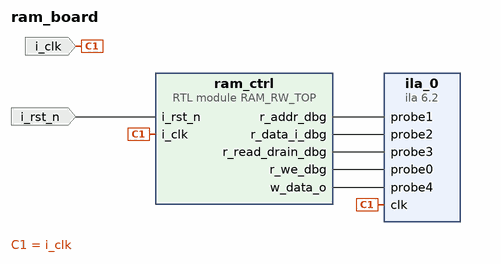
[diagram p0: block diagram of the top level]
# Vivado block design ram_board, xc7z020clg484-2, Vivado 2023.1
create_bd_design ram_board

create_bd_port -dir I -type clk i_clk
set_property -dict {CONFIG.FREQ_HZ 50000000} [get_bd_ports i_clk]
create_bd_port -dir I -type rst i_rst_n
set_property -dict {CONFIG.POLARITY ACTIVE_LOW} [get_bd_ports i_rst_n]

create_bd_cell -type module -reference RAM_RW_TOP ram_ctrl
create_bd_cell -type ip -vlnv xilinx.com:ip:ila:6.2 ila_0
set_property -dict [list \
  CONFIG.C_DATA_DEPTH 1024 \
  CONFIG.C_NUM_OF_PROBES 5 \
  CONFIG.C_PROBE0_WIDTH 1 \
  CONFIG.C_PROBE1_WIDTH 11 \
  CONFIG.C_PROBE2_WIDTH 16 \
  CONFIG.C_PROBE3_WIDTH 1 \
  CONFIG.C_PROBE4_WIDTH 16 \
] [get_bd_cells ila_0]

# ---- connections ----

connect_bd_net [get_bd_ports i_clk] [get_bd_pins ram_ctrl/i_clk] [get_bd_pins ila_0/clk]
connect_bd_net [get_bd_ports i_rst_n] [get_bd_pins ram_ctrl/i_rst_n]
connect_bd_net [get_bd_pins ram_ctrl/r_addr_dbg] [get_bd_pins ila_0/probe1]
connect_bd_net [get_bd_pins ram_ctrl/r_data_i_dbg] [get_bd_pins ila_0/probe2]
connect_bd_net [get_bd_pins ram_ctrl/r_read_drain_dbg] [get_bd_pins ila_0/probe3]
connect_bd_net [get_bd_pins ram_ctrl/r_we_dbg] [get_bd_pins ila_0/probe0]
connect_bd_net [get_bd_pins ram_ctrl/w_data_o] [get_bd_pins ila_0/probe4]

validate_bd_design
save_bd_design
